# Altium schematic sheet XY131B 65W-2C1A-V1.SchDoc
size 500 x 350 mm; SheetNumber: 1; SheetTotal: 1
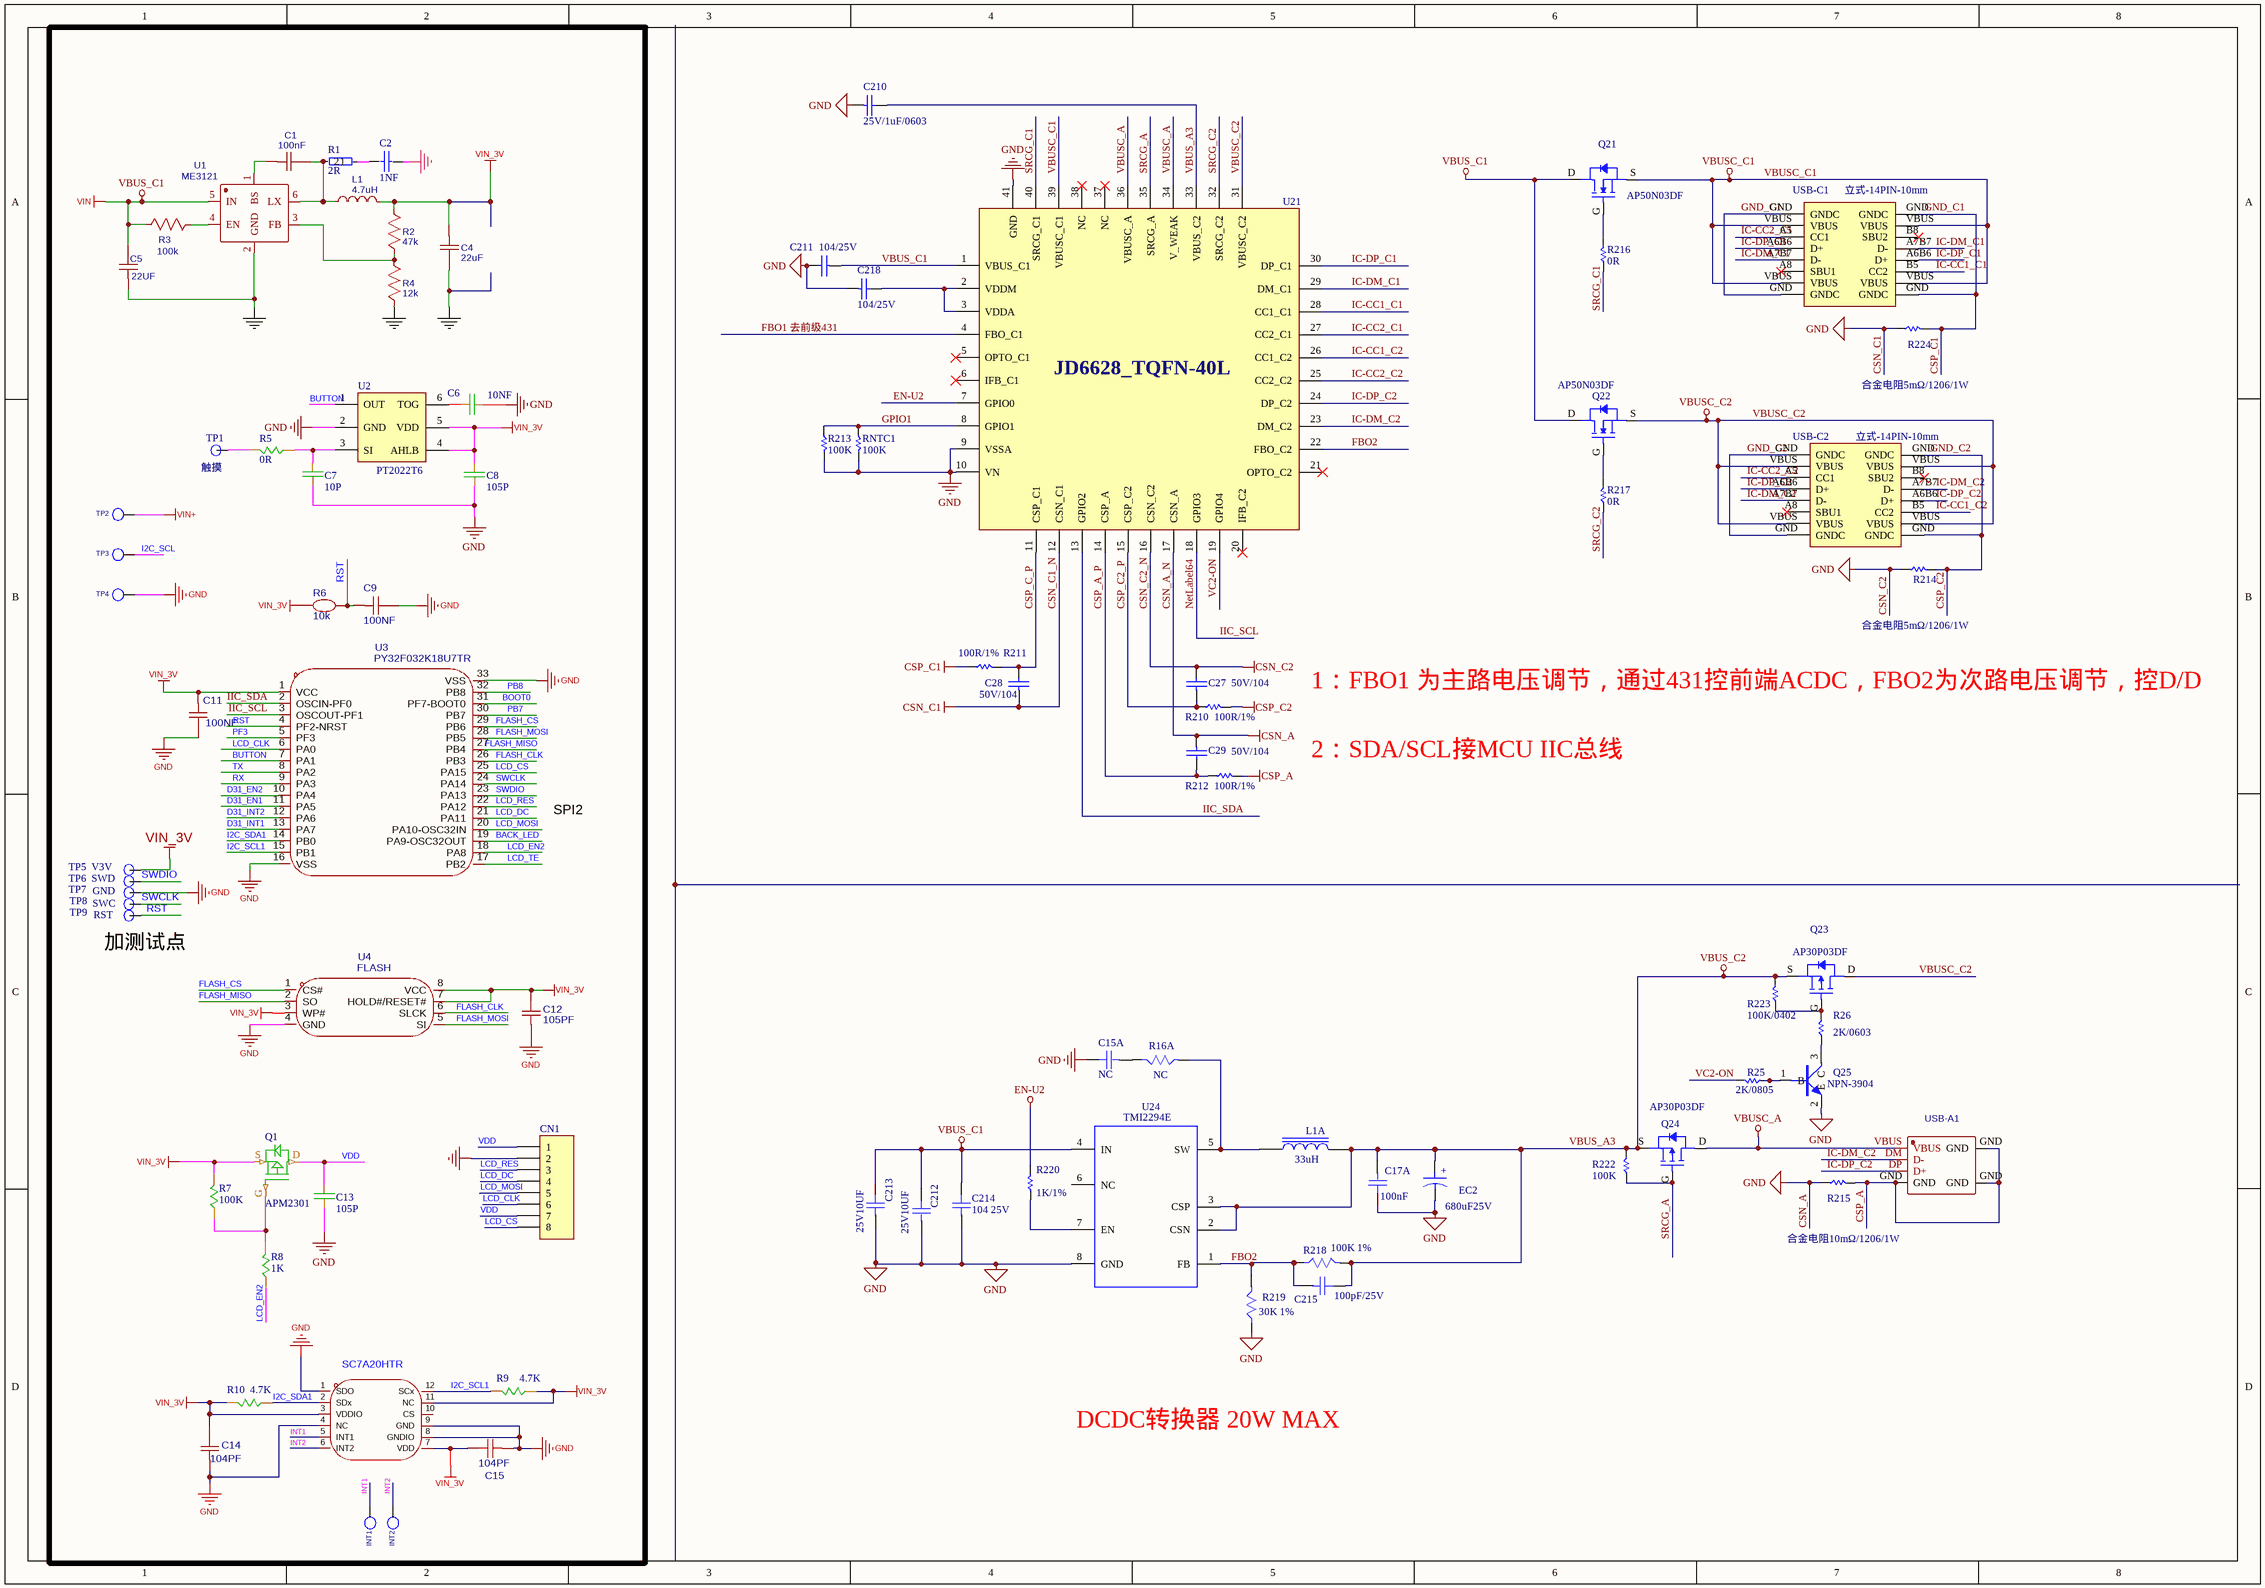
[diagram p0: XY131B 65W-2C1A-V1.SchDoc]

## Parts
C1  100nF  [C 0402_L]
C2  1NF  [C 0402_L]
C4  22uF  [C 0805_L]
C5  22UF  [C 0805_L]
C6  10NF  [C 0402_L]
C7  10P  [C 0402_L]
C8  105P  [C 0402_L]
C9  100NF  [C 0402_L]
C11  100NF  [C 0402_L]
C12  105PF  [C 0402_L]
C13  105P  [C 0402_L]
C14  104PF  [C 0402_L]
C15  104PF  [C 0402_L]
C15A  NC  [C0603-SMD]
C17A  100nF  [C0603-SMD]
C27  50V/104  [C0402-SMD]
C28  50V/104  [C0402-SMD]
C29  50V/104  [C0402-SMD]
C210  25V/1uF/0603  [C0402-SMD]
C211  104/25V  [C0402-SMD]
C212  25V10UF  [C1206-SMD]
C213  25V10UF  [C1206-SMD]
C214  104 25V  [C0603-SMD]
C215  100pF/25V  [C0603-SMD]
C218  104/25V  [C0402-SMD]
CN1  Header 8  [HDR1X8]  (value not drawn)
EC2  680uF25V  [CAP-F2.5-D5-AI]
INT1  TEST  [焊盘椭圆]  (value not drawn)
INT2  TEST  [焊盘椭圆]  (value not drawn)
L1  4.7uH  [CD32]
L1A  33uH  [PL2-T040-125-22UH-卧室 -]
Q1  APM2301  [SOT23-MOS]
Q21  AP50N03DF  [DFN3*3mm]
Q22  AP50N03DF  [DFN3*3mm]
Q23  AP30P03DF  [DFN3*3mm]
Q24  AP30P03DF  [DFN3*3mm]
Q25  NPN-3904  [SOP-23-3 NPN/PNP]
R1  2R  [R 0402_L]
R2  47k  [R 0402_L]
R3  100k  [R 0402_L]
R4  12k  [R 0402_L]
R5  0R  [R 0402_L]
R6  10k  [R 0402_L]
R7  100K  [R 0402_L]
R8  1K  [R 0402_L]
R9  4.7K  [R 0402_L]
R10  4.7K  [R 0402_L]
R16A  NC  [R0603-SMD]
R25  2K/0805  [R0402-SMD]
R26  2K/0603  [R0603-SMD]
R210  100R/1%  [R0402-SMD]
R211  100R/1%  [R0402-SMD]
R212  100R/1%  [R0402-SMD]
R213  100K  [R0402-SMD]
R214  合金电阻5mΩ/1206/1W  [R1206-SMD]
R215  合金电阻10mΩ/1206/1W  [R1206-SMD]
R216  0R  [R0402-SMD]
R217  0R  [R0402-SMD]
R218  100K 1%  [R0603-SMD]
R219  30K 1%  [R0603-SMD]
R220  1K/1%  [R0402-SMD]
R222  100K  [R0402-SMD]
R223  100K/0402  [R0402-SMD]
R224  合金电阻5mΩ/1206/1W  [R1206-SMD]
RNTC1  100K  [R0402-SMD]
TP1  触摸  [焊盘1.5mm]
TP2  TEST  [焊盘椭圆]  (value not drawn)
TP3  TEST  [焊盘椭圆]  (value not drawn)
TP4  TEST  [焊盘椭圆]  (value not drawn)
TP5  V3V  [焊盘1.5*2.5mm]
TP6  SWD  [焊盘1.5*2.5mm]
TP7  GND  [焊盘1.5*2.5mm]
TP8  SWC  [焊盘1.5*2.5mm]
TP9  RST  [焊盘1.5*2.5mm]
U1  ME3121  [SOT23-6]
U2  PT2022T6  [SOT23-6]
U3  PY32F032K18U7TR  [QFN32 4*4]
U4  FLASH  [SOP8]
U5  SC7A20HTR  [SC7A20]
U21  JD6628_TQFN-40L  [QFN5*5-40L]
U24  TMI2294E  [SOP-8-SMD]
USB-A1  USB-A母-10mm-平口  [USB4-TM  立式]  (value not drawn)
USB-C1  立式-14PIN-10mm  [USB-TYPE-C-14PIN-立式-TM-PIN少]
USB-C2  立式-14PIN-10mm  [USB-TYPE-C-14PIN-立式-TM-PIN少]

## Blocks framed on the sheet
加测试点: C1 C2 C4-C9 C11-C15 CN1 INT1 INT2 L1 Q1 R1-R10 TP1-TP9 U1-U5

## Nets
CSN_A: C2.1 C4.1 C5.2 C6.2 C7.1 C8.2 C9.1 C11.1 C12.2 C13.1 C14.2 C15.2 C15A.1 C17A.1 C27.2 C28.1 C29.1 C210.1 C211.2 C212.2 C213.2 C214.2 C218.1 CN1.2 EC2.2 Q25.2(E) R4.1 R213.2 R214.1 R215.1 R219.2 R224.1 RNTC1.2 TP4.1 TP7.1 U1.2(GND) U2.2(GND) U3.16(VSS) U3.33(VSS) U4.4(GND) U5.1(SDO) U5.4(NC) U5.8(GNDIO) U5.9(GND) U21.9(VSSA) U21.10(VN) U21.12(CSN_C1) U21.16(CSN_C2) U21.17(CSN_A) U21.41(GND) U24.8(GND)  [also labelled CSN_A_N, CSN_C1, CSN_C1_N, CSN_C2, CSN_C2_N, GND]
CSP_A: R212.2 R215.2 USB-A1.GND
CSP_C1: R211.1 R224.2 USB-C1.GND(GNDC)  [also labelled GND_C1]
CSP_C2: R210.2 R214.2 USB-C2.GND(GNDC)  [also labelled GND_C2]
EN-U2: R220.2 U21.7(GPIO0)
VBUS_A3: C17A.2 C210.2 C215.1 EC2.1 L1A.2 Q23.S Q24.S R218.1 R222.2 R223.2 U21.33(VBUS_C2) U24.2(CSN) U24.3(CSP)  [also labelled VBUS_C2]
VBUS_C1: C5.1 C211.1 Q21.D Q22.D R3.2 U1.5(IN) U21.1(VBUS_C1)  [also labelled VIN]
VBUSC_A: Q24.D U21.34(V_WEAK) U21.36(VBUSC_A) USB-A1.VBUS
VBUSC_C1: Q21.S U21.39(VBUSC_C1) USB-C1.VBUS
VBUSC_C2: Q22.S Q23.D U21.31(VBUSC_C2) USB-C2.VBUS
VIN+: TP2.1
VIN_3V: C4.2 C8.1 C11.2 C12.1 C14.1 C15.1 L1.2 Q1.S R2.2 R6.2 R7.2 R9.1 R10.2 TP5.1 U2.4(AHLB) U2.5(VDD) U3.1(VCC) U4.3(WP#) U4.7(HOLD#/RESET#) U4.8(VCC) U5.3(VDDIO) U5.7(VDD) U5.11(NC)
BACK_LED: U3.19(PA9-OSC32OUT)
BOOT0: U3.31(PF7-BOOT0)
BUTTON: U2.1(OUT) U3.7(PA1)
CSP_A_P: C29.2 R212.1 U21.14(CSP_A)
CSP_C2_P: C27.1 R210.1 U21.15(CSP_C2)
CSP_C_P: C28.2 R211.2 U21.11(CSP_C1)
D31_EN1: U3.11(PA5)
D31_EN2: U3.10(PA4)
D31_INT1: U3.13(PA7)
D31_INT2: U3.12(PA6)
FBO1 去前级431: U21.4(FBO_C1)
FBO2: C215.2 R218.2 R219.1 U21.22(FBO_C2) U24.1(FB)
FLASH_CLK: U3.26(PB3) U4.6(SLCK)
FLASH_CS: U3.29(PB6) U4.1(CS#)
FLASH_MISO: U3.27(PB4) U4.2(SO)
FLASH_MOSI: U3.28(PB5) U4.5(SI)
GPIO1: R213.1 RNTC1.1 U21.8(GPIO1)
I2C_SCL: TP3.1
I2C_SCL1: R9.2 U3.15(PB1) U5.12(SCx)
I2C_SDA1: R10.1 U3.14(PB0) U5.2(SDx)
IC-CC1_C1: U21.28(CC1_C1) USB-C1.B5(CC2)
IC-CC1_C2: U21.26(CC1_C2) USB-C2.B5(CC2)
IC-CC2_C1: U21.27(CC2_C1) USB-C1.A5(CC1)
IC-CC2_C2: U21.25(CC2_C2) USB-C2.A5(CC1)
IC-DM_C1: U21.29(DM_C1) USB-C1.A7B7(D-)
IC-DM_C2: U21.23(DM_C2) USB-A1.DM(D-) USB-C2.A7B7(D-)
IC-DP_C1: U21.30(DP_C1) USB-C1.A6B6(D+)
IC-DP_C2: U21.24(DP_C2) USB-A1.DP(D+) USB-C2.A6B6(D+)
IIC_SCL: U3.3(OSCOUT-PF1) U21.18(GPIO3)  [also labelled NetLabel64]
IIC_SDA: U3.2(OSCIN-PF0) U21.13(GPIO2)
INT1: INT1.1 U5.5(INT1)
INT2: INT2.1 U5.6(INT2)
LCD_CLK: CN1.6 U3.6(PA0)
LCD_CS: CN1.8 U3.25(PA15)
LCD_DC: CN1.4 U3.21(PA11)
LCD_EN2: R8.1 U3.18(PA8)
LCD_MOSI: CN1.5 U3.20(PA10-OSC32IN)
LCD_RES: CN1.3 U3.22(PA12)
LCD_TE: U3.17(PB2)
PB7: U3.30(PB7)
PB8: U3.32(PB8)
PF3: U3.5(PF3)
RST: C9.2 R6.1 TP9.1 U3.4(PF2-NRST)
RX: U3.9(PA3)
SRCG_A: Q24.G R222.1 U21.35(SRCG_A)
SRCG_C1: R216.1 U21.40(SRCG_C1)
SRCG_C2: R217.1 U21.32(SRCG_C2)
SWCLK: TP8.1 U3.24(PA14)
SWDIO: TP6.1 U3.23(PA13)
TX: U3.8(PA2)
VC2-ON: R25.2 U21.19(GPIO4)
VDD: C13.2 CN1.1 CN1.7 Q1.D
NetC1_1: C1.1 L1.1 R1.2 U1.6(LX)
NetC1_2: C1.2 U1.1(BS)
NetC2_2: C2.2 R1.1
NetC6_1: C6.1 U2.6(TOG)
NetC7_2: C7.2 R5.1 U2.3(SI)
NetC15A_2: C15A.2 R16A.2
NetC212_1: C212.1 C213.1 C214.1 U24.4(IN)
NetC218_2: C218.2 U21.2(VDDM) U21.3(VDDA)
NetL1A_1: L1A.1 R16A.1 U24.5(SW)
NetQ1_G: Q1.G R7.1 R8.2
NetQ21_G: Q21.G R216.2
NetQ22_G: Q22.G R217.2
NetQ23_G: Q23.G R26.2 R223.1
NetQ25_1: Q25.1(B) R25.1
NetQ25_3: Q25.3(C) R26.1
NetR2_1: R2.1 R4.2 U1.3(FB)
NetR3_1: R3.1 U1.4(EN)
NetR5_2: R5.2 TP1.1
NetR220_1: R220.1 U24.7(EN)

Not connected (* = marked no-connect by the designer): U5 10(CS); U21 5(OPTO_C1)* 6(IFB_C1)* 20(IFB_C2)* 21(OPTO_C2)* 37(NC)* 38(NC)*; U24 6(NC); USB-C1 A8(SBU1)* B8(SBU2)*; USB-C2 A8(SBU1)* B8(SBU2)*

## Notes on the sheet
- 1：FBO1 为主路电压调节，通过431控前端ACDC，FBO2为次路电压调节，控D/D
- 2：SDA/SCL接MCU IIC总线
- SPI2
- DCDC转换器 20W MAX
- Labels drawn without touching a wire or pin: VBUS_C1
- (in symbol Ecap 8*12) +

## Library data of the parts
C1 = 22nF: 贴片电容：100NF/25V-X7R-0402; nameAlias: Value(F); Contributor: LCEDA_Lib; spicePre: C; spiceSymbolName: C_0603_US
C2 = C0402: 贴片电容：1NF/50V-X7R-0402; PCB DECAL: 0402; Comment_1: C0402
C4 = 22uF: 贴片电容：22UF/10V-X7R-0805; nameAlias: Value(F); Contributor: LCEDA_Lib; spicePre: C; spiceSymbolName: C_0805_US
C5 = 10uF: 贴片电容：22UF/35V-X7R-0805; nameAlias: Value(F); Contributor: LCEDA_Lib; spicePre: C; spiceSymbolName: C_0603_US
C6 = CAP: 贴片电容：10NF/10V-X5R-0402
C7 = CAP: 贴片电容：10P/10V-X5R-0402
C8 C13 = CAP: 贴片电容：105P/10V-X5R-0402
C9 = 10uF: 贴片电容：100NF/10V-X7R-0805; Convert to PCB: yes; UniqueId: gge1e13a888c85ebaed; ModelId: ac9b32e974bc448eab36b1293f859dcb; ModelName: C0603_L1.6-W0.8-H0.8; ModelTransform: v2:[39.37007874015748,0,0,0,39.37007874015748,0,0,0,39.37007874015748,0.001,0,0]; Device: 10uF; Add into BOM: yes; SymbolName: 10uF; FootprintName: C0603
C11 = 0.1u: 贴片电容：100NF/10V-X5R-0402; Convert to PCB: yes; UniqueId: gge4f251fc7ae9908d9; ModelId: ac9b32e974bc448eab36b1293f859dcb; ModelName: C0603_L1.6-W0.8-H0.8; ModelTransform: v2:[39.37007874015748,0,0,0,39.37007874015748,0,0,0,39.37007874015748,0.001,0,0]; Device: 0.1u; Add into BOM: yes; SymbolName: 0.1u; FootprintName: C0603
C12 = 0.1u: 贴片电容：105P/10V-X5R-0402; Convert to PCB: yes; UniqueId: ggeeecb535e2993774a; ModelId: ac9b32e974bc448eab36b1293f859dcb; ModelName: C0603_L1.6-W0.8-H0.8; ModelTransform: v2:[39.37007874015748,0,0,0,39.37007874015748,0,0,0,39.37007874015748,0.001,0,0]; Device: 0.1u; Add into BOM: yes; SymbolName: 0.1u; FootprintName: C0603
C14 C15 = 0.1u: 贴片电容：104P/10V-X5R-0402; Convert to PCB: yes; UniqueId: ggeeecb535e2993774a; ModelId: ac9b32e974bc448eab36b1293f859dcb; ModelName: C0603_L1.6-W0.8-H0.8; ModelTransform: v2:[39.37007874015748,0,0,0,39.37007874015748,0,0,0,39.37007874015748,0.001,0,0]; Device: 0.1u; Add into BOM: yes; SymbolName: 0.1u; FootprintName: C0603
C15A = Cap0603: 贴片电容; _Footprint: 0603; Value: NC; Type: 贴片电容
C17A C214 C215 = Cap1210: Cap 1206; Type: 贴片电容; _Footprint: 1206
  C17A: Value: 100nF
  C214: Value: 104 25V
  C215: Value: 100pF/25V
C27-C29 C210 C211 C218 = CAP
C212 C213 = Cap1206: Cap 1206; Type: 贴片电容; Value: 25V10UF
CN1 = Header 8: Header, 8-Pin; LatestRevisionDate: 17-Jul-2002; LatestRevisionNote: Re-released for DXP Platform.; Publisher: Altium Limited
EC2 = Ecap 8*12: _footprint: 8*12; Value: ？; Type: Ecap
INT1 INT2 TP2-TP4 = TEST: PCB DECAL: TPSM
L1 = 4.7uH: 贴片电感：0420-4.7UH; Manufacturer: Sunlord; Manufacturer Part: MPH252012S4R7MT; nameAlias: Inductance; Supplier: LCSC; Supplier Part: C90256; spicePre: L; spiceSymbolName: MPH252012S4R7MT
L1A = 功率电感: value: 33uH; _FootPrint: =Footprint; Type: 功率电感
Q1 = MOS_P: 贴片MOS：APM2301-SOT23-3
Q21 Q22 = MOS\NMOS\FKS4004: SOP-8
Q23 Q24 = MOS\PMOS\CEM3083: SOP-8
Q25 = NPN: NPN Transistor
R1 = R0402: 贴片电阻：2R-0402-F; PCB DECAL: 0402; Comment_1: R0402
R2 = 75k: 贴片电阻：47K-0402-1%; nameAlias: Value(Ω); Contributor: LCEDA_Lib; spicePre: R; spiceSymbolName: R_0603_US
R3 = 100k: 贴片电阻：100K-0402-1%; nameAlias: Value(Ω); Contributor: LCEDA_Lib; spicePre: R; spiceSymbolName: R_0603_US
R4 = 10k: 贴片电阻：12K-0402-1%; nameAlias: Value(Ω); Contributor: LCEDA_Lib; spicePre: R; spiceSymbolName: R_0603_US
R5 = R: 贴片电阻：0R-0402-F
R6 = 10k: 贴片电阻：10K-0402-F; Convert to PCB: yes; UniqueId: gged69dc30bc6f01ca4; ModelId: 6bd5cd867e9542ebae21caaf5d2d4c4d; ModelName: R0603; ModelTransform: v2:[2.410722045565656e-15,39.37007874015748,0,-39.37007874015748,2.410722045565656e-15,0,0,0,39.37007874015748,0,0,0]; Device: 10k; Add into BOM: yes; SymbolName: 10k; FootprintName: R0603
R7 = R: 贴片电阻：100K-0402-F
R8 = R: 贴片电阻：1K-0402-F
R9 R10 = R: 贴片电阻：4.7K-0402-F
R16A = Res0603: 贴片电阻; _Footprint: 0603; Value: NC; Type: 电阻; 厂商编号: *
R25 R26 R210-R217 R220 R222-R224 RNTC1 = RES SMD
R218 R219 = Res0603: 电阻; _Footprint: 0603; Type: 电阻; 厂商编号: *
  R218: Value: 100K 1%
  R219: Value: 30K 1%
TP1 TP5-TP9 = TP
U1 = TD8113: 贴片IC：ME3121-SOT23-6; Manufacturer: TMI; Manufacturer Part: STI3470; Contributor: wwjlisa; SMT Type: Extend; Supplier: LCSC; Supplier Part: C478938; LCSC Assembly: Yes; link: unknown; spicePre: U; spiceSymbolName: STI3470
U2 = SOT23-MCU: 贴片触摸：PT2022T6-SOT23-6
U3 = PY32F031: 贴片IC：PY32F032K18U7TR-QFN32-4*4; Manufacturer: PUYA(普冉); Manufacturer Part: PY32F030K28U6TR; Convert to PCB: yes; UniqueId: gge62ac414b3116667d; ModelId: 595304ab79a843bfa03bdaf869386976; ModelName: QFN-32_L5.0-W5.0-H1.0-P0.50-TL-EP3.5; ModelTransform: v2:[39.37007874015748,0,0,0,39.37007874015748,0,0,0,39.37007874015748,0.001,0,0]; Device: PY32F031; Supplier: LCSC; Supplier Part: C3018718; JLCPCB Part Class: Extended Part; Add into BOM: yes; SymbolName: PY32F031; FootprintName: QFN-32_L5.0-W5.0-P0.50-TL-EP3.5
U4 = P25Q64H-SUH-IT: Manufacturer: PUYA(普冉); Convert to PCB: yes; UniqueId: ggeec8bb7aad7322074; ModelId: fc9b9a2dc0bb4458871072ce0a00885d; ModelName: SOP-8_L5.2-W5.3-H2.1-LS7.9-P1.27; ModelTransform: v2:[2.410722045565656e-15,39.37007874015748,0,-39.37007874015748,2.410722045565656e-15,0,0,0,39.37007874015748,0,0,0]; Device: P25Q64H-SUH-IT; Supplier: LCSC; Supplier Part: C414065; Manufacturer Part: P25Q64H-SUH-IT; JLCPCB Part Class: Extended Part; Add into BOM: yes; SymbolName: P25Q64H-SUH-IT; FootprintName: SOP-8_L5.3-W5.3-P1.27-LS8.0-BL
U5 = sc7a20htr: 贴片IC：SC7A20HTR-LGA-12-2x2x1.0; Manufacturer: SILAN(士兰微); AddInBom: yes; ModelId: f8457c06ad0d429192ad95232aa1f660; ModelName: LGA-12_L2.0-W2.0-H1.0-P0.50; ModelTransform: 78.74,78.74,0,0,0,0,0.001,-0.004,0; Accelerometer Sensing Axis: X,Y,Z; Acceleration Measurement Range (MAX): ±16g; Sensor Type: 加速度计; Output Bits: 12bit; Interface: I2C；SPI; Voltage - Supply: 1.71V~3.6V; Standby Current: 500nA; Symbol: SC7A20HTR; LCSC Part Name: ±2G/±4G/±8G/±16G三轴微机械数字加速度计; SupplierPart: C19274408; ManufacturerPart: SC7A20HTR; Supplier Footprint: LGA-12(2x2); JLCPCB Part Class: Extended Part; Datasheet: https://item.szlcsc.com/datasheet/SC7A20HTR/20603496.html; Supplier: LCSC; ConvertToPcb: yes; FootprintName: LGA-12_L2.0-W2.0-P0.50-TL; Gyroscope Sensing Axis: -; Gyroscope Measurement Range (MAX): -; Cache Size: -; Operating Temperature: -40℃~+85℃; Features: 运动事件检测
U21 = JD6628_TQFN-40L: TQFN-40L
U24 = TMI2293Q: IC-DCDC
USB-A1 = USB-246-BRW: BOM_Manufacturer: XUNPU; Contributor: LCSC; BOM_Supplier: LCSC; BOM_Supplier Part: C720532; BOM_Manufacturer Part: USB-246-BRW; BOM_JLCPCB Part Class: Extended Part; spicePre: U; spiceSymbolName: USB-246-BRW
USB-C1 USB-C2 = USB_Type C_FEMALE_16PIN